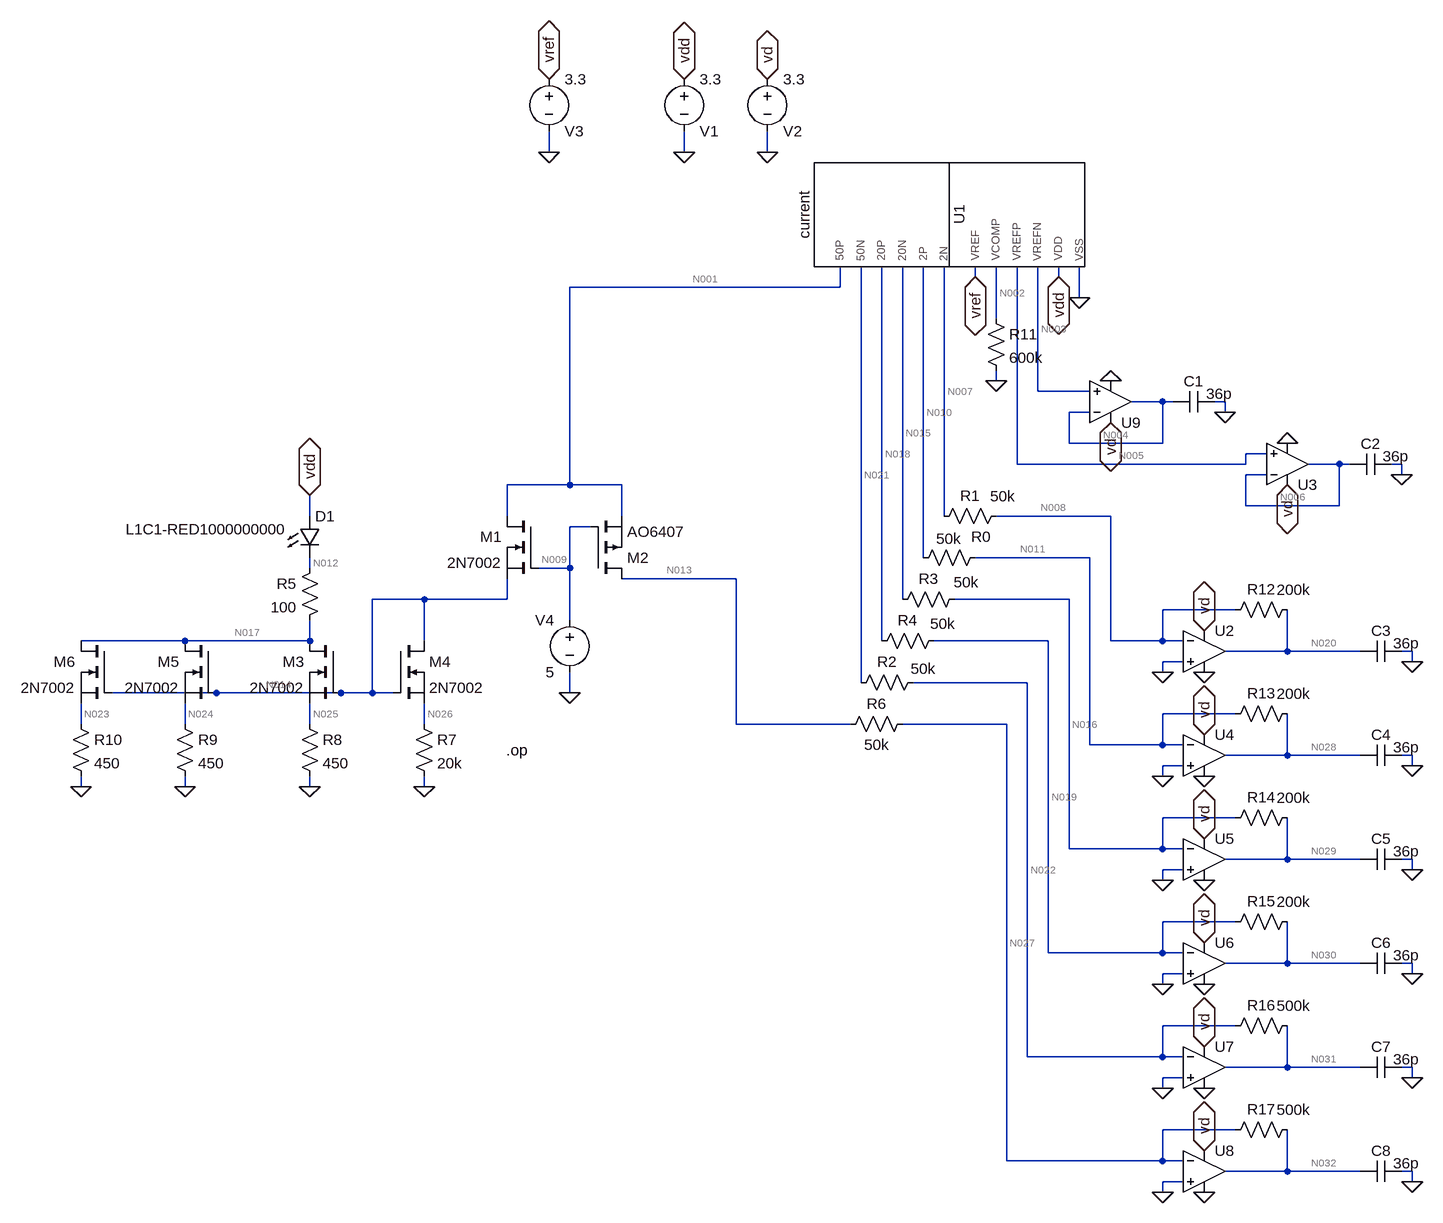
[diagram p0: schematic Chipa_schem_1V.asc]
Chipa_schem_1V.asc, the LTspice schematic file:
Version 4
SHEET 1 2624 4428
WIRE -320 64 -320 32
WIRE -112 64 -112 32
WIRE 16 64 16 32
WIRE 336 256 336 240
WIRE 464 256 464 240
WIRE 128 272 128 240
WIRE 128 272 -288 272
WIRE 496 288 496 240
WIRE 368 320 368 240
WIRE 368 416 368 400
WIRE 432 432 432 240
WIRE 512 432 432 432
WIRE 624 448 576 448
WIRE 640 448 624 448
WIRE 720 448 704 448
WIRE 512 464 480 464
WIRE 720 464 720 448
WIRE 480 512 480 464
WIRE 624 512 624 448
WIRE 624 512 480 512
WIRE 784 528 752 528
WIRE 400 544 400 240
WIRE 752 544 752 528
WIRE 752 544 400 544
WIRE 896 544 848 544
WIRE 912 544 896 544
WIRE 992 544 976 544
WIRE 784 560 752 560
WIRE 992 560 992 544
WIRE -288 576 -288 272
WIRE -288 576 -384 576
WIRE -208 576 -288 576
WIRE 752 608 752 560
WIRE 896 608 896 544
WIRE 896 608 752 608
WIRE -688 624 -688 592
WIRE -384 624 -384 576
WIRE -208 624 -208 576
WIRE 288 624 288 240
WIRE 544 624 368 624
WIRE -256 640 -288 640
WIRE 256 688 256 240
WIRE 512 688 336 688
WIRE -688 704 -688 688
WIRE -288 704 -288 640
WIRE -288 704 -336 704
WIRE -32 720 -208 720
WIRE -512 752 -592 752
WIRE -384 752 -384 720
WIRE -384 752 -512 752
WIRE 224 752 224 240
WIRE 480 752 304 752
WIRE 736 768 624 768
WIRE -288 784 -288 704
WIRE -880 816 -1040 816
WIRE -688 816 -688 784
WIRE -688 816 -880 816
WIRE -512 816 -512 752
WIRE 192 816 192 240
WIRE 448 816 272 816
WIRE 544 816 544 624
WIRE 624 816 624 768
WIRE 624 816 544 816
WIRE 656 816 624 816
WIRE 816 832 816 768
WIRE 816 832 720 832
WIRE 928 832 816 832
WIRE 1008 832 992 832
WIRE 656 848 624 848
WIRE 1008 848 1008 832
WIRE 624 864 624 848
WIRE 160 880 160 240
WIRE 416 880 240 880
WIRE -832 896 -992 896
WIRE -640 896 -832 896
WIRE -592 896 -592 752
WIRE -592 896 -640 896
WIRE -560 896 -592 896
WIRE -288 896 -288 864
WIRE 736 928 624 928
WIRE -1040 944 -1040 912
WIRE -880 944 -880 912
WIRE -688 944 -688 912
WIRE -512 944 -512 912
WIRE -32 944 -32 720
WIRE 144 944 -32 944
WIRE 384 944 224 944
WIRE 512 976 512 688
WIRE 624 976 624 928
WIRE 624 976 512 976
WIRE 656 976 624 976
WIRE 816 992 816 928
WIRE 816 992 720 992
WIRE 928 992 816 992
WIRE 1008 992 992 992
WIRE 656 1008 624 1008
WIRE 1008 1008 1008 992
WIRE 624 1024 624 1008
WIRE -1040 1040 -1040 1024
WIRE -880 1040 -880 1024
WIRE -688 1040 -688 1024
WIRE -512 1040 -512 1024
WIRE 736 1088 624 1088
WIRE 480 1136 480 752
WIRE 624 1136 624 1088
WIRE 624 1136 480 1136
WIRE 656 1136 624 1136
WIRE 816 1152 816 1088
WIRE 816 1152 720 1152
WIRE 928 1152 816 1152
WIRE 1008 1152 992 1152
WIRE 656 1168 624 1168
WIRE 1008 1168 1008 1152
WIRE 624 1184 624 1168
WIRE 736 1248 624 1248
WIRE 448 1296 448 816
WIRE 624 1296 624 1248
WIRE 624 1296 448 1296
WIRE 656 1296 624 1296
WIRE 816 1312 816 1248
WIRE 816 1312 720 1312
WIRE 928 1312 816 1312
WIRE 1008 1312 992 1312
WIRE 656 1328 624 1328
WIRE 1008 1328 1008 1312
WIRE 624 1344 624 1328
WIRE 736 1408 624 1408
WIRE 416 1456 416 880
WIRE 624 1456 624 1408
WIRE 624 1456 416 1456
WIRE 656 1456 624 1456
WIRE 816 1472 816 1408
WIRE 816 1472 720 1472
WIRE 928 1472 816 1472
WIRE 1008 1472 992 1472
WIRE 656 1488 624 1488
WIRE 1008 1488 1008 1472
WIRE 624 1504 624 1488
WIRE 736 1568 624 1568
WIRE 384 1616 384 944
WIRE 624 1616 624 1568
WIRE 624 1616 384 1616
WIRE 656 1616 624 1616
WIRE 816 1632 816 1568
WIRE 816 1632 720 1632
WIRE 928 1632 816 1632
WIRE 1008 1632 992 1632
WIRE 656 1648 624 1648
WIRE 1008 1648 1008 1632
WIRE 624 1664 624 1648
FLAG -112 64 0
FLAG -320 64 0
FLAG -112 -48 vdd
IOPIN -112 -48 BiDir
FLAG -320 -48 vref
IOPIN -320 -48 BiDir
FLAG -288 896 0
FLAG -688 592 vdd
IOPIN -688 592 BiDir
FLAG 496 288 0
FLAG 464 256 vdd
IOPIN 464 256 BiDir
FLAG 336 256 vref
IOPIN 336 256 BiDir
FLAG -512 1040 0
FLAG -688 1040 0
FLAG 544 480 vd
IOPIN 544 480 BiDir
FLAG 720 464 0
FLAG 816 576 vd
IOPIN 816 576 BiDir
FLAG 992 560 0
FLAG -880 1040 0
FLAG -1040 1040 0
FLAG 368 416 0
FLAG 688 800 vd
IOPIN 688 800 BiDir
FLAG 624 864 0
FLAG 16 64 0
FLAG 16 -48 vd
IOPIN 16 -48 BiDir
FLAG 688 864 0
FLAG 544 416 0
FLAG 816 512 0
FLAG 688 960 vd
IOPIN 688 960 BiDir
FLAG 624 1024 0
FLAG 688 1024 0
FLAG 688 1120 vd
IOPIN 688 1120 BiDir
FLAG 624 1184 0
FLAG 688 1184 0
FLAG 688 1280 vd
IOPIN 688 1280 BiDir
FLAG 624 1344 0
FLAG 688 1344 0
FLAG 688 1440 vd
IOPIN 688 1440 BiDir
FLAG 624 1504 0
FLAG 688 1504 0
FLAG 688 1600 vd
IOPIN 688 1600 BiDir
FLAG 624 1664 0
FLAG 688 1664 0
FLAG 1008 848 0
FLAG 1008 1008 0
FLAG 1008 1168 0
FLAG 1008 1328 0
FLAG 1008 1488 0
FLAG 1008 1648 0
DATAFLAG -320 576 ""
DATAFLAG -880 736 "I(R5)"
DATAFLAG -480 752 ""
DATAFLAG 48 992 "I(R6)"
DATAFLAG 368 864 "I(R2)"
DATAFLAG 400 800 "I(R4)"
DATAFLAG 432 736 "I(R3)"
DATAFLAG 432 672 "I(R0)"
DATAFLAG 432 608 "I(R1)"
DATAFLAG 624 448 ""
DATAFLAG 896 544 ""
DATAFLAG 464 432 ""
DATAFLAG 464 528 ""
DATAFLAG 576 624 ""
DATAFLAG 608 768 ""
DATAFLAG 816 832 ""
DATAFLAG 288 576 ""
DATAFLAG 256 672 ""
DATAFLAG 224 736 ""
DATAFLAG 192 688 ""
DATAFLAG 160 832 ""
DATAFLAG 608 928 ""
DATAFLAG 816 992 ""
DATAFLAG 608 1088 ""
DATAFLAG 816 1152 ""
DATAFLAG 608 1248 ""
DATAFLAG 816 1312 ""
DATAFLAG 608 1408 ""
DATAFLAG 816 1472 ""
DATAFLAG 608 1568 ""
DATAFLAG 816 1632 ""
DATAFLAG 320 992 "I(R6)"
SYMBOL current 176 160 R0
WINDOW 0 120 0 VTop 2
SYMATTR InstName U1
SYMBOL res 384 608 R90
WINDOW 0 0 56 VBottom 2
WINDOW 3 -30 6 VTop 2
SYMATTR InstName R1
SYMATTR Value 50k
SYMBOL res 352 672 R90
WINDOW 0 -1 7 VBottom 2
WINDOW 3 -29 57 VTop 2
SYMATTR InstName R0
SYMATTR Value 50k
SYMBOL res 320 736 R90
WINDOW 0 0 56 VBottom 2
WINDOW 3 -26 -2 VTop 2
SYMATTR InstName R3
SYMATTR Value 50k
SYMBOL res 288 800 R90
WINDOW 0 0 56 VBottom 2
WINDOW 3 -26 2 VTop 2
SYMATTR InstName R4
SYMATTR Value 50k
SYMBOL res 144 896 R270
WINDOW 0 32 56 VTop 2
WINDOW 3 53 112 VBottom 2
SYMATTR InstName R2
SYMATTR Value 50k
SYMBOL voltage -112 -64 R0
WINDOW 0 24 96 Left 2
WINDOW 3 24 16 Left 2
WINDOW 123 0 0 Left 0
WINDOW 39 0 0 Left 0
SYMATTR InstName V1
SYMATTR Value 3.3
SYMBOL voltage -320 -64 R0
WINDOW 0 24 96 Left 2
WINDOW 3 24 16 Left 2
WINDOW 123 0 0 Left 0
WINDOW 39 0 0 Left 0
SYMATTR InstName V3
SYMATTR Value 3.3
SYMBOL nmos -336 624 M0
SYMATTR InstName M1
SYMATTR Value 2N7002
SYMBOL pmos -256 720 M180
SYMATTR InstName M2
SYMATTR Value AO6407
SYMBOL voltage -288 768 M0
WINDOW 123 0 0 Left 0
WINDOW 39 0 0 Left 0
SYMATTR InstName V4
SYMATTR Value 5
SYMBOL nmos -640 816 M0
SYMATTR InstName M3
SYMATTR Value 2N7002
SYMBOL nmos -560 816 R0
SYMATTR InstName M4
SYMATTR Value 2N7002
SYMBOL res -672 688 M0
SYMATTR InstName R5
SYMATTR Value 100
SYMBOL res 240 928 R90
WINDOW 0 0 56 VBottom 2
WINDOW 3 32 56 VTop 2
SYMATTR InstName R6
SYMATTR Value 50k
SYMBOL res -528 928 R0
SYMATTR InstName R7
SYMATTR Value 20k
SYMBOL res -704 928 R0
SYMATTR InstName R8
SYMATTR Value 450
SYMBOL LED -704 624 R0
WINDOW 3 -267 20 Left 2
SYMATTR Value L1C1-RED1000000000
SYMATTR InstName D1
SYMATTR Description Diode
SYMATTR Type diode
SYMBOL cap 704 432 R90
WINDOW 0 0 32 VBottom 2
WINDOW 3 -12 -7 VTop 2
SYMATTR InstName C1
SYMATTR Value 36p
SYMBOL cap 976 528 R90
WINDOW 0 0 32 VBottom 2
WINDOW 3 -12 -7 VTop 2
SYMATTR InstName C2
SYMATTR Value 36p
SYMBOL nmos -832 816 M0
SYMATTR InstName M5
SYMATTR Value 2N7002
SYMBOL res -896 928 R0
SYMATTR InstName R9
SYMATTR Value 450
SYMBOL nmos -992 816 M0
SYMATTR InstName M6
SYMATTR Value 2N7002
SYMBOL res -1056 928 R0
SYMATTR InstName R10
SYMATTR Value 450
SYMBOL res 352 304 R0
SYMATTR InstName R11
SYMATTR Value 600k
SYMBOL res 832 752 R90
WINDOW 0 0 56 VBottom 2
WINDOW 3 -30 6 VTop 2
SYMATTR InstName R12
SYMATTR Value 200k
SYMBOL voltage 16 -64 R0
WINDOW 0 24 96 Left 2
WINDOW 3 24 16 Left 2
WINDOW 123 0 0 Left 0
WINDOW 39 0 0 Left 0
SYMATTR InstName V2
SYMATTR Value 3.3
SYMBOL res 832 912 R90
WINDOW 0 0 56 VBottom 2
WINDOW 3 -30 6 VTop 2
SYMATTR InstName R13
SYMATTR Value 200k
SYMBOL res 832 1072 R90
WINDOW 0 0 56 VBottom 2
WINDOW 3 -30 6 VTop 2
SYMATTR InstName R14
SYMATTR Value 200k
SYMBOL res 832 1232 R90
WINDOW 0 0 56 VBottom 2
WINDOW 3 -30 6 VTop 2
SYMATTR InstName R15
SYMATTR Value 200k
SYMBOL res 832 1392 R90
WINDOW 0 0 56 VBottom 2
WINDOW 3 -30 6 VTop 2
SYMATTR InstName R16
SYMATTR Value 500k
SYMBOL res 832 1552 R90
WINDOW 0 0 56 VBottom 2
WINDOW 3 -30 6 VTop 2
SYMATTR InstName R17
SYMATTR Value 500k
SYMBOL OpAmps\\UniversalOpAmp 688 832 R0
SYMATTR InstName U2
SYMBOL OpAmps\\UniversalOpAmp 688 992 R0
SYMATTR InstName U4
SYMBOL OpAmps\\UniversalOpAmp 688 1152 R0
SYMATTR InstName U5
SYMBOL OpAmps\\UniversalOpAmp 688 1312 R0
SYMATTR InstName U6
SYMBOL OpAmps\\UniversalOpAmp 688 1472 R0
SYMATTR InstName U7
SYMBOL OpAmps\\UniversalOpAmp 688 1632 R0
SYMATTR InstName U8
SYMBOL OpAmps\\UniversalOpAmp 816 544 M180
SYMATTR InstName U3
SYMBOL OpAmps\\UniversalOpAmp 544 448 M180
SYMATTR InstName U9
SYMBOL cap 992 816 R90
WINDOW 0 0 32 VBottom 2
WINDOW 3 -12 -7 VTop 2
SYMATTR InstName C3
SYMATTR Value 36p
SYMBOL cap 992 976 R90
WINDOW 0 0 32 VBottom 2
WINDOW 3 -12 -7 VTop 2
SYMATTR InstName C4
SYMATTR Value 36p
SYMBOL cap 992 1136 R90
WINDOW 0 0 32 VBottom 2
WINDOW 3 -12 -7 VTop 2
SYMATTR InstName C5
SYMATTR Value 36p
SYMBOL cap 992 1296 R90
WINDOW 0 0 32 VBottom 2
WINDOW 3 -12 -7 VTop 2
SYMATTR InstName C6
SYMATTR Value 36p
SYMBOL cap 992 1456 R90
WINDOW 0 0 32 VBottom 2
WINDOW 3 -12 -7 VTop 2
SYMATTR InstName C7
SYMATTR Value 36p
SYMBOL cap 992 1616 R90
WINDOW 0 0 32 VBottom 2
WINDOW 3 -12 -7 VTop 2
SYMATTR InstName C8
SYMATTR Value 36p
TEXT -352 984 Right 2 !.op

The netlist it stands for:
* Chipa_schem_1V.asc
XU1 vref N002 N003 N005 vdd N015 N018 N021 N001 N007 N010 0 current  ; pins VREF VCOMP VREFN VREFP VDD 20N 20P 50N 50P 2N 2P VSS
R1 N008 N007 50k
R0 N011 N010 50k
R3 N016 N015 50k
R4 N019 N018 50k
R2 N021 N022 50k
V1 vdd 0 3.3
V3 vref 0 3.3
M1 N001 N009 N014 N014 2N7002
M2 N013 N009 N001 N001 AO6407
V4 N009 0 5
M3 N017 N014 N025 N025 2N7002
M4 N014 N014 N026 N026 2N7002
R5 N012 N017 100
R6 N027 N013 50k
R7 N026 0 20k
R8 N025 0 450
D1 vdd N012 L1C1-RED1000000000
C1 0 N004 36p
C2 0 N006 36p
M5 N017 N014 N024 N024 2N7002
R9 N024 0 450
M6 N017 N014 N023 N023 2N7002
R10 N023 0 450
R11 N002 0 600k
R12 N020 N008 200k
V2 vd 0 3.3
R13 N028 N011 200k
R14 N029 N016 200k
R15 N030 N019 200k
R16 N031 N022 500k
R17 N032 N027 500k
XU2 0 N008 vd 0 N020 level1 Avol=1Meg GBW=10Meg Vos=0 En=0 Enk=0 In=0 Ink=0 Rin=500Meg  ; pins In+ In- V+ V- OUT
XU4 0 N011 vd 0 N028 level1 Avol=1Meg GBW=10Meg Vos=0 En=0 Enk=0 In=0 Ink=0 Rin=500Meg  ; pins In+ In- V+ V- OUT
XU5 0 N016 vd 0 N029 level1 Avol=1Meg GBW=10Meg Vos=0 En=0 Enk=0 In=0 Ink=0 Rin=500Meg  ; pins In+ In- V+ V- OUT
XU6 0 N019 vd 0 N030 level1 Avol=1Meg GBW=10Meg Vos=0 En=0 Enk=0 In=0 Ink=0 Rin=500Meg  ; pins In+ In- V+ V- OUT
XU7 0 N022 vd 0 N031 level1 Avol=1Meg GBW=10Meg Vos=0 En=0 Enk=0 In=0 Ink=0 Rin=500Meg  ; pins In+ In- V+ V- OUT
XU8 0 N027 vd 0 N032 level1 Avol=1Meg GBW=10Meg Vos=0 En=0 Enk=0 In=0 Ink=0 Rin=500Meg  ; pins In+ In- V+ V- OUT
XU3 N005 N006 vd 0 N006 level1 Avol=1Meg GBW=10Meg Vos=0 En=0 Enk=0 In=0 Ink=0 Rin=500Meg  ; pins In+ In- V+ V- OUT
XU9 N003 N004 vd 0 N004 level1 Avol=1Meg GBW=10Meg Vos=0 En=0 Enk=0 In=0 Ink=0 Rin=500Meg  ; pins In+ In- V+ V- OUT
C3 0 N020 36p
C4 0 N028 36p
C5 0 N029 36p
C6 0 N030 36p
C7 0 N031 36p
C8 0 N032 36p
.model D D
.lib standard.dio
.model NMOS NMOS
.model PMOS PMOS
.lib standard.mos
.op
.lib C:\Users\escor\OneDrive\Escritorio\Alex onchip\current.txt
.lib UniversalOpAmp1.lib
.backanno
.end

* Results of the author's LTspice run, read from the files saved beside the schematic
* Operating Point:
*   V(vref) = 3.3 V
*   V(n002) = 0 V
*   V(n003) = 750 mV
*   V(n005) = 2.15 V
*   V(vdd) = 3.3 V
*   V(n007) = 100 mV
*   V(n010) = 100 mV
*   V(n015) = 1 V
*   V(n018) = 1 V
*   V(n021) = 2.5 V
*   V(n001) = 2.471 V
*   V(n008) = 400.7 nV
*   V(n011) = 400.7 nV
*   V(n016) = 4.001 µV
*   V(n019) = 4.001 µV
*   V(n022) = 25 µV
*   V(n009) = 5 V
*   V(n014) = 2.471 V
*   V(n013) = 1.549 µV
*   V(n017) = 1.237 V
*   V(n025) = 756.9 mV
*   V(n026) = 1 V
*   V(n012) = 1.742 V
*   V(n027) = 1.665 nV
*   V(n004) = 750 mV
*   V(n006) = 2.15 V
*   V(n024) = 756.9 mV
*   V(n023) = 756.9 mV
*   V(n020) = -400.7 mV
*   V(vd) = 3.3 V
*   V(n028) = -400.7 mV
*   V(n029) = -4.001 V
*   V(n030) = -4.001 V
*   V(n031) = -25 V
*   V(n032) = -1.665 mV
*   Id(M1) = 50 µA
*   Ig(M1) = -79.67 pA
*   Is(M1) = -50 µA
*   Id(M3) = 1.682 mA
*   Ig(M3) = -75.86 pA
*   Is(M3) = -1.682 mA
*   Id(M4) = 50 µA
*   Ig(M4) = -53.55 pA
*   Is(M4) = -50 µA
*   Id(M5) = 1.682 mA
*   Ig(M5) = -75.86 pA
*   Is(M5) = -1.682 mA
*   Id(M6) = 1.682 mA
*   Ig(M6) = -75.86 pA
*   Is(M6) = -1.682 mA
*   Id(M2) = 74.55 pA
*   Ig(M2) = -103 pA
*   Is(M2) = 28.47 pA
*   I(C1) = 0 A
*   I(C2) = 0 A
*   I(C3) = 0 A
*   I(C4) = 0 A
*   I(C5) = 0 A
*   I(C6) = 0 A
*   I(C7) = 0 A
*   I(C8) = 0 A
*   I(D1) = 5.046 mA
*   I(R1) = -2 µA
*   I(R0) = -2 µA
*   I(R3) = -20 µA
*   I(R4) = -20 µA
*   I(R2) = 50 µA
*   I(R5) = 5.046 mA
*   I(R6) = -30.94 pA
*   I(R7) = 50 µA
*   I(R8) = 1.682 mA
*   I(R9) = 1.682 mA
*   I(R10) = 1.682 mA
*   I(R11) = 0 A
*   I(R12) = -2.003 µA
*   I(R13) = -2.003 µA
*   I(R14) = -20 µA
*   I(R15) = -20 µA
*   I(R16) = -50 µA
*   I(R17) = -3.331 nA
*   I(V1) = -5.19 mA
*   I(V3) = -3.3 mA
*   I(V4) = 0 A
*   I(V2) = -47 nA
* From the log:
*   Semiconductor Device Operating Points:
*                           --- Diodes ---
*   Name:          d1
*   Model: l1c1-red1000000000
*   Id:          5.05e-03
*   Vd:          1.56e+00
*   Req:         8.82e+00
*   CAP:         9.01e-10
*                           --- VDMOSFET Transistors ---
*   Name:          m1          m3          m4          m5          m6
*   Model:       2n7002      2n7002      2n7002      2n7002      2n7002
*   Id:          5.00e-05    1.68e-03    5.00e-05    1.68e-03    1.68e-03
*   Vgs:         2.53e+00    1.71e+00    1.47e+00    1.71e+00    1.71e+00
*   Vds:         2.91e-04    4.80e-01    1.47e+00    4.80e-01    4.80e-01
*   Vth:         1.60e+00    1.60e+00    1.60e+00    1.60e+00    1.60e+00
*   Gm:          5.38e-05    1.81e-02    8.88e-04    1.81e-02    1.81e-02
*   Gds:         1.97e-01    0.00e+00    0.00e+00    0.00e+00    0.00e+00
*   Cgs:         5.00e-11    5.00e-11    5.00e-11    5.00e-11    5.00e-11
*   Cgd:         7.97e-11    7.59e-11    5.35e-11    7.59e-11    7.59e-11
*   Cbody:       5.00e-11    4.11e-11    3.18e-11    4.11e-11    4.11e-11
*   Name:          m2
*   Model:       ao6407
*   Id:          7.45e-11
*   Vgs:         2.53e+00
*   Vds:        -2.47e+00
*   Vth:        -8.00e-01
*   Gm:          3.96e-29
*   Gds:         0.00e+00
*   Cgs:         9.00e-10
*   Cgd:         1.03e-10
*   Cbody:       1.40e-10